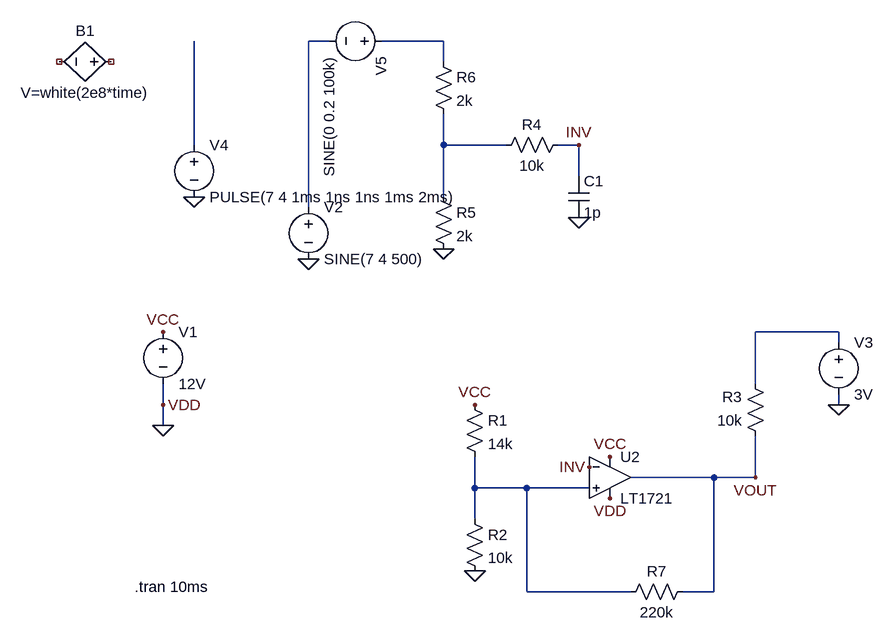
[diagram p0: schematic comparator_hysteresis.asc]
comparator_hysteresis.asc, the LTspice schematic file:
Version 4
SHEET 1 880 680
WIRE -80 -480 -112 -480
WIRE 96 -480 0 -480
WIRE 96 -448 96 -480
WIRE -288 -320 -288 -480
WIRE 96 -320 96 -368
WIRE 192 -320 96 -320
WIRE 304 -320 272 -320
WIRE 304 -272 304 -320
WIRE 96 -240 96 -320
WIRE -112 -224 -112 -480
WIRE 704 -32 576 -32
WIRE 704 -16 704 -32
WIRE 576 48 576 -32
WIRE -336 80 -336 48
WIRE 704 80 704 64
WIRE -336 112 -336 80
WIRE 512 192 384 192
WIRE 576 192 576 128
WIRE 576 192 512 192
WIRE 144 208 144 160
WIRE 224 208 144 208
WIRE 320 208 224 208
WIRE 144 256 144 208
WIRE 224 368 224 208
WIRE 384 368 224 368
WIRE 512 368 512 192
WIRE 512 368 464 368
FLAG 352 160 VCC
FLAG 352 224 VDD
FLAG -336 112 0
FLAG -336 -32 VCC
FLAG -336 80 VDD
FLAG 144 336 0
FLAG 144 80 VCC
FLAG 304 -320 INV
FLAG 320 176 INV
FLAG 304 -208 0
FLAG -112 -144 0
FLAG 704 80 0
FLAG 576 192 VOUT
FLAG 96 -160 0
FLAG -288 -240 0
SYMBOL res 128 64 R0
SYMATTR InstName R1
SYMATTR Value 14k
SYMBOL res 128 240 R0
SYMATTR InstName R2
SYMATTR Value 10k
SYMBOL res 592 144 R180
WINDOW 0 36 76 Left 2
WINDOW 3 36 40 Left 2
SYMATTR InstName R3
SYMATTR Value 10k
SYMBOL res 288 -336 R90
WINDOW 0 0 56 VBottom 2
WINDOW 3 32 56 VTop 2
SYMATTR InstName R4
SYMATTR Value 10k
SYMBOL voltage -336 -48 R0
WINDOW 123 0 0 Left 0
WINDOW 39 0 0 Left 0
SYMATTR InstName V1
SYMATTR Value 12V
SYMBOL voltage -112 -240 R0
WINDOW 123 0 0 Left 0
WINDOW 39 0 0 Left 0
SYMATTR InstName V2
SYMATTR Value SINE(7 4 500)
SYMBOL cap 288 -272 R0
SYMATTR InstName C1
SYMATTR Value 1p
SYMBOL voltage 704 -32 R0
WINDOW 123 0 0 Left 0
WINDOW 39 0 0 Left 0
SYMATTR InstName V3
SYMATTR Value 3V
SYMBOL Comparators\\LT1721 352 128 R0
SYMATTR InstName U2
SYMBOL res 80 -256 R0
SYMATTR InstName R5
SYMATTR Value 2k
SYMBOL res 80 -464 R0
SYMATTR InstName R6
SYMATTR Value 2k
SYMBOL voltage -288 -336 R0
WINDOW 123 0 0 Left 0
WINDOW 39 0 0 Left 0
SYMATTR InstName V4
SYMATTR Value PULSE(7 4 1ms 1ns 1ns 1ms 2ms)
SYMBOL res 480 352 R90
WINDOW 0 0 56 VBottom 2
WINDOW 3 32 56 VTop 2
SYMATTR InstName R7
SYMATTR Value 220k
SYMBOL bv -400 -448 R90
WINDOW 0 -32 56 VBottom 2
WINDOW 3 32 56 VTop 2
SYMATTR InstName B1
SYMATTR Value V=white(2e8*time)
SYMBOL voltage 16 -480 R90
WINDOW 123 0 0 Left 0
WINDOW 39 0 0 Left 0
SYMATTR InstName V5
SYMATTR Value SINE(0 0.2 100k)
TEXT -380 360 Left 2 !.tran 10ms

The netlist it stands for:
* comparator_hysteresis.asc
R1 VCC N006 14k
R2 N006 0 10k
R3 VOUT N005 10k
R4 INV N004 10k
V1 VCC 0 12V
V2 N001 0 SINE(7 4 500)
C1 INV 0 1p
V3 N005 0 3V
XU2 N006 INV VCC 0 VOUT LT1720  ; LT1721, pins In+ In- V+ V- OUT
R5 N004 0 2k
R6 N002 N004 2k
V4 N003 0 PULSE(7 4 1ms 1ns 1ns 1ms 2ms)
R7 VOUT N006 220k
B1 NC_01 NC_02 V=white(2e8*time)
V5 N002 N001 SINE(0 0.2 100k)
.tran 10ms
.lib LTC.lib
.backanno
.end